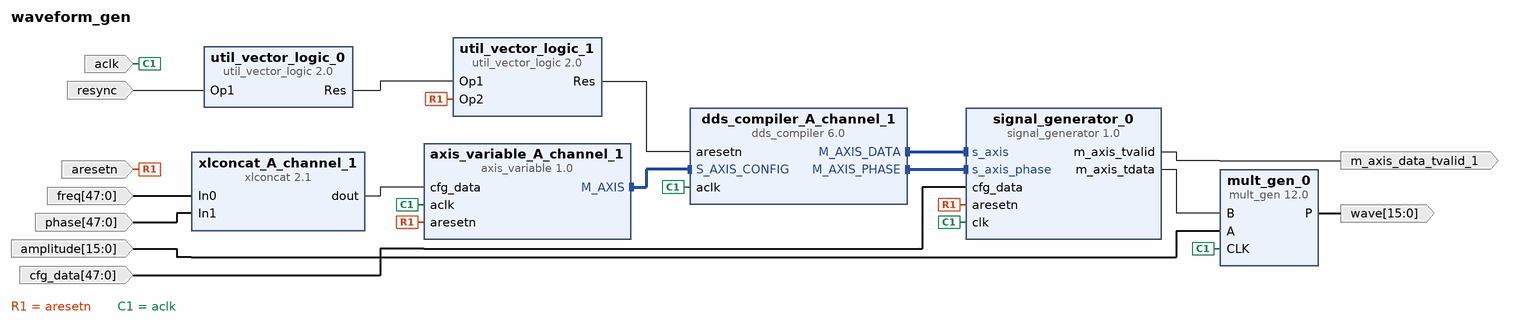
[diagram p0: block diagram of the top level]
# Vivado block design waveform_gen, xc7z010clg400-1, Vivado 2021.2
create_bd_design waveform_gen

create_bd_port -dir I -type clk aclk
set_property -dict {CONFIG.ASSOCIATED_RESET aresetn CONFIG.FREQ_HZ 125000000} [get_bd_ports aclk]
create_bd_port -dir I -from 15 -to 0 -type data amplitude
create_bd_port -dir I -type rst aresetn
create_bd_port -dir I -from 47 -to 0 cfg_data
create_bd_port -dir I -from 47 -to 0 freq
create_bd_port -dir O m_axis_data_tvalid_1
create_bd_port -dir I -from 47 -to 0 phase
create_bd_port -dir I resync
create_bd_port -dir O -from 15 -to 0 -type data wave

create_bd_cell -type ip -vlnv pavel-demin:user:axis_variable:1.0 axis_variable_A_channel_1
set_property -dict {CONFIG.AXIS_TDATA_WIDTH 96} [get_bd_cells axis_variable_A_channel_1]
create_bd_cell -type ip -vlnv xilinx.com:ip:dds_compiler:6.0 dds_compiler_A_channel_1
set_property -dict [list \
  CONFIG.Amplitude_Mode Unit_Circle \
  CONFIG.DATA_Has_TLAST Not_Required \
  CONFIG.DDS_Clock_Rate 125 \
  CONFIG.DSP48_Use Maximal \
  CONFIG.Frequency_Resolution 4.440893e-7 \
  CONFIG.Has_ACLKEN false \
  CONFIG.Has_ARESETn true \
  CONFIG.Has_Phase_Out true \
  CONFIG.Has_TREADY false \
  CONFIG.Latency 8 \
  CONFIG.Latency_Configuration Auto \
  CONFIG.M_DATA_Has_TUSER Not_Required \
  CONFIG.M_PHASE_Has_TUSER Not_Required \
  CONFIG.Memory_Type Distributed_ROM \
  CONFIG.Noise_Shaping Auto \
  CONFIG.Optimization_Goal Auto \
  CONFIG.Output_Frequency1 0 \
  CONFIG.Output_Selection Sine \
  CONFIG.Output_Width 16 \
  CONFIG.PINC1 0 \
  CONFIG.POFF1 0 \
  CONFIG.Parameter_Entry System_Parameters \
  CONFIG.PartsPresent Phase_Generator_and_SIN_COS_LUT \
  CONFIG.Phase_Increment Programmable \
  CONFIG.Phase_Offset_Angles1 0 \
  CONFIG.Phase_Width 48 \
  CONFIG.Phase_offset Programmable \
  CONFIG.Resync false \
  CONFIG.S_PHASE_Has_TUSER Not_Required \
  CONFIG.Spurious_Free_Dynamic_Range 96 \
] [get_bd_cells dds_compiler_A_channel_1]
create_bd_cell -type ip -vlnv xilinx.com:ip:mult_gen:12.0 mult_gen_0
set_property -dict [list \
  CONFIG.Multiplier_Construction Use_Mults \
  CONFIG.OutputWidthHigh 30 \
  CONFIG.OutputWidthLow 15 \
  CONFIG.PipeStages 3 \
  CONFIG.PortAType Unsigned \
  CONFIG.PortAWidth 16 \
  CONFIG.PortBType Signed \
  CONFIG.PortBWidth 16 \
  CONFIG.SyncClear false \
  CONFIG.Use_Custom_Output_Width true \
] [get_bd_cells mult_gen_0]
create_bd_cell -type ip -vlnv jbeuke:user:signal_generator:1.0 signal_generator_0
set_property -dict [list \
  CONFIG.AXIS_TDATA_PHASE_WIDTH 48 \
  CONFIG.CFG_DATA_WIDTH 48 \
  CONFIG.DAC_WIDTH 15 \
] [get_bd_cells signal_generator_0]
create_bd_cell -type ip -vlnv xilinx.com:ip:util_vector_logic:2.0 util_vector_logic_0
set_property -dict {CONFIG.C_OPERATION not CONFIG.C_SIZE 1} [get_bd_cells util_vector_logic_0]
create_bd_cell -type ip -vlnv xilinx.com:ip:util_vector_logic:2.0 util_vector_logic_1
set_property -dict {CONFIG.C_SIZE 1} [get_bd_cells util_vector_logic_1]
create_bd_cell -type ip -vlnv xilinx.com:ip:xlconcat:2.1 xlconcat_A_channel_1
set_property -dict [list \
  CONFIG.IN0_WIDTH 48 \
  CONFIG.IN1_WIDTH 48 \
  CONFIG.IN2_WIDTH 8 \
  CONFIG.NUM_PORTS 2 \
] [get_bd_cells xlconcat_A_channel_1]

# ---- connections ----

connect_bd_intf_net [get_bd_intf_pins axis_variable_A_channel_1/M_AXIS] [get_bd_intf_pins dds_compiler_A_channel_1/S_AXIS_CONFIG]
connect_bd_intf_net [get_bd_intf_pins dds_compiler_A_channel_1/M_AXIS_DATA] [get_bd_intf_pins signal_generator_0/s_axis]
connect_bd_intf_net [get_bd_intf_pins dds_compiler_A_channel_1/M_AXIS_PHASE] [get_bd_intf_pins signal_generator_0/s_axis_phase]
connect_bd_net -net amplitude_A_channel_1_slice1_Dout [get_bd_ports amplitude] [get_bd_pins mult_gen_0/A]
connect_bd_net [get_bd_ports aresetn] \
  [get_bd_pins axis_variable_A_channel_1/aresetn] [get_bd_pins signal_generator_0/aresetn] \
  [get_bd_pins util_vector_logic_1/Op2]
connect_bd_net -net clk_wiz_0_clk_internal [get_bd_ports aclk] \
  [get_bd_pins axis_variable_A_channel_1/aclk] [get_bd_pins dds_compiler_A_channel_1/aclk] [get_bd_pins mult_gen_0/CLK] \
  [get_bd_pins signal_generator_0/clk]
connect_bd_net [get_bd_ports freq] [get_bd_pins xlconcat_A_channel_1/In0]
connect_bd_net [get_bd_pins mult_gen_0/P] [get_bd_ports wave]
connect_bd_net [get_bd_ports phase] [get_bd_pins xlconcat_A_channel_1/In1]
connect_bd_net -net phase_A_channel_1_slice1_Dout [get_bd_ports cfg_data] [get_bd_pins signal_generator_0/cfg_data]
connect_bd_net [get_bd_ports resync] [get_bd_pins util_vector_logic_0/Op1]
connect_bd_net [get_bd_pins signal_generator_0/m_axis_tdata] [get_bd_pins mult_gen_0/B]
connect_bd_net [get_bd_pins signal_generator_0/m_axis_tvalid] [get_bd_ports m_axis_data_tvalid_1]
connect_bd_net [get_bd_pins util_vector_logic_0/Res] [get_bd_pins util_vector_logic_1/Op1]
connect_bd_net [get_bd_pins util_vector_logic_1/Res] [get_bd_pins dds_compiler_A_channel_1/aresetn]
connect_bd_net [get_bd_pins xlconcat_A_channel_1/dout] [get_bd_pins axis_variable_A_channel_1/cfg_data]

validate_bd_design
save_bd_design
